# EasyEDA Pro project elisaday-high-color-value-low-cost-reflow-24a201e4.epro, board 控制板-无0402
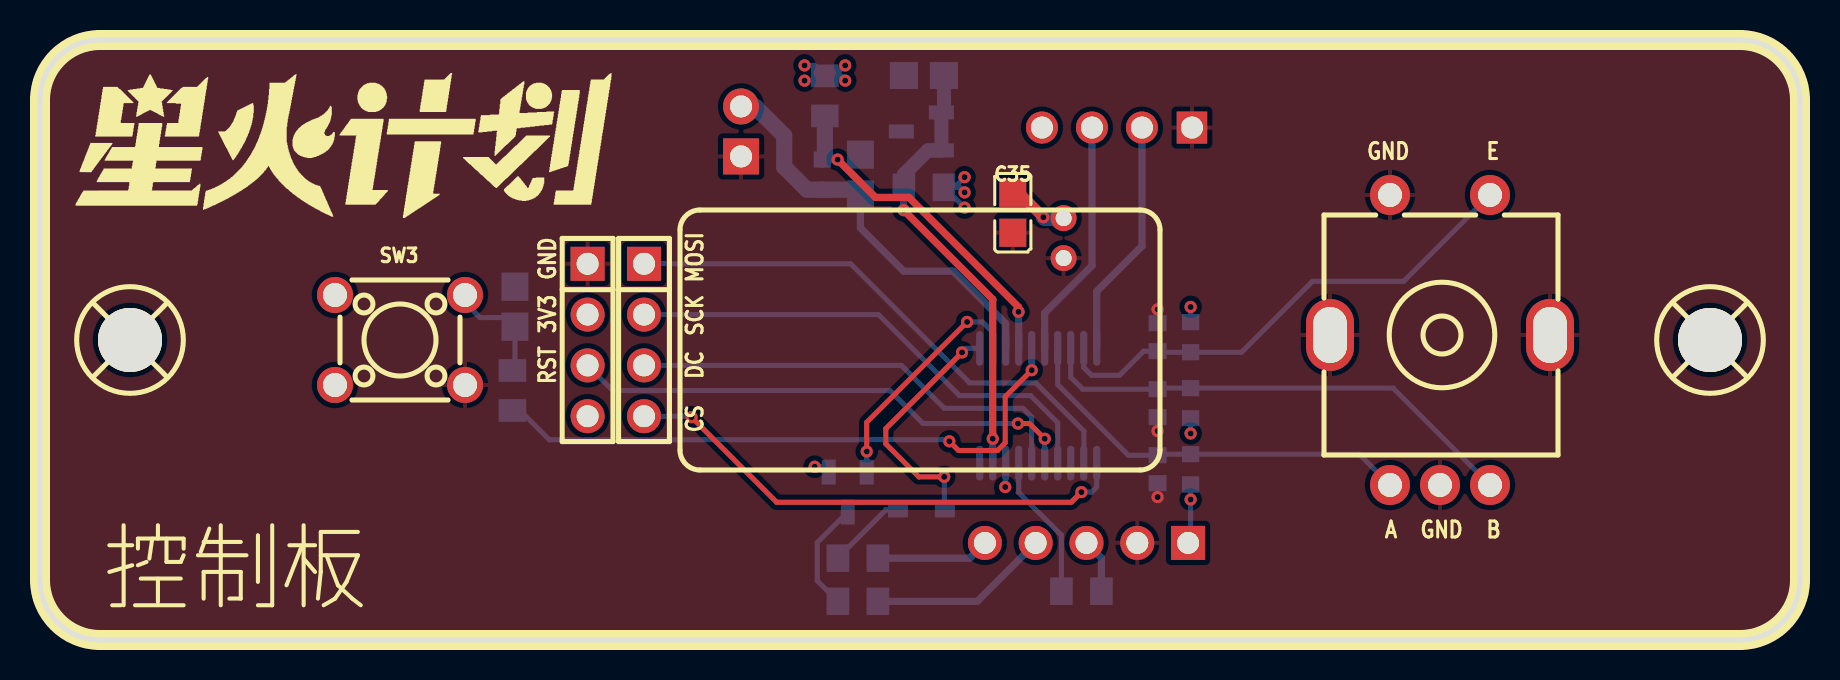
[diagram p3: board, top side]
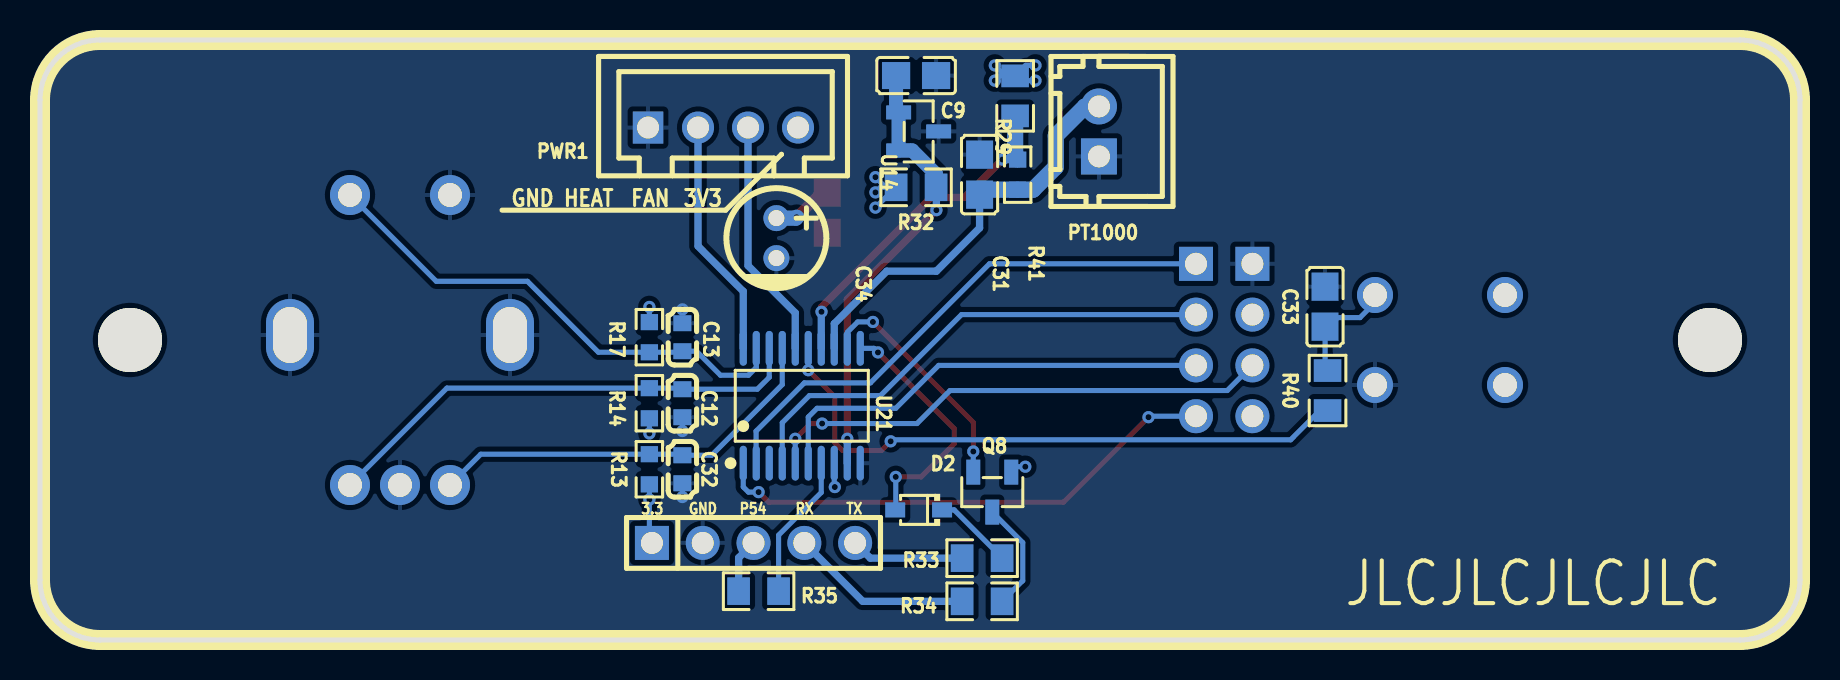
[diagram p4: board, bottom side, seen from below]

Outline 88 x 30 mm; copper layers: Top Layer, Inner1, Inner2, Bottom Layer. Coordinates in mm from the lower left corner of the outline.
Outline path: 0,27 0,3 arc(0.88,0.88) 3,0 85,0 arc(87.12,0.88) 88,3 88,27 arc(87.12,29.12) 85,30 3,30 arc(0.88,29.12) 0,27
Stack: Top Layer 0.035mm 外层铜厚1oz / Dielectric1 0.2104mm 7628 RC49% 8.6mil / Inner1 0.0152mm 内层铜厚 / Dielectric2 1.065mm 1.1mm H/HOZ Copper / Inner2 0.0152mm 内层铜厚 / Dielectric3 0.2104mm 7628 RC49% 8.6mil / Bottom Layer 0.035mm 外层铜厚1oz

## Design rules (mm)
spacing copperThickness1oz (default): track to track 0.102, other pairs 0.152 to 0.3
spacing copperThickness2oz: track to track 0.203, other pairs 0.152 to 0.3
spacing Plane_innerPlane: track to track 0.102, other pairs 0.152 to 0.3
spacing Copper_copperRegion: track to track 0.102, other pairs 0.152 to 0.3
track width copperThickness1oz (default): min 0.127, default 0.254, max 2.54
track width copperThickness2oz: min 0.203, default 0.254, max 2.54
differential pair differentialPair (default): width min 0.127, default 0.254, max 2.54; gap min 0.152, default 0.152
pour e203 uses Copper_copperRegion
pour e241 uses Copper_copperRegion
pour e258 uses Copper_copperRegion
pour e299 uses Copper_copperRegion

## Placement (name value [footprint] x y rotation side)
C9  10uF  [C0805]  44.2 28.22 0 bottom
C12  33nF  [C0603]  55.88 11.84 90 bottom
C13  33nF  [C0603]  55.88 15.14 90 bottom
C31  100nF  [C0805]  41.02 23.27 270 bottom
C32  33nF  [C0603]  55.88 8.54 270 bottom
C33  100nF  [C0805]  23.75 16.67 270 bottom
C34  10uF  [CAP-TH_BD5.0-P2.00-D0.8-FD]  51.18 20.09 270 bottom
C35  100nF  [C0805]  48.64 21.36 90 top
D2  B5819WS  [SOD-323_L1.8-W1.3-LS2.5-RD]  44.07 6.5 0 bottom
H4  PZ254V-11-05P  [HDR-TH_5P-P2.54-V-M]  52.32 4.85 180 bottom
LCD1  PZ254V-11-04P  [HDR-TH_4P-P2.54-V-M]  27.38 15 270 top
LCD3  PZ254V-11-04P  [HDR-TH_4P-P2.54-V-M]  30.2 15 270 top
PT1000  ZX-XH2.54-2PZZ  [CONN-TH_2P-P2.50_HX25003-2A]  35.05 25.43 90 bottom
PWR1  ZX-XH2.54-4PZZ  [CONN-TH_4P-P2.50_4PIN]  53.85 25.62 180 bottom
Q8  SI2302A  [SOT-23-3_L2.9-W1.3-P1.90-LS2.4-BR]  40.39 7.39 90 bottom
R13  3.3kΩ  [R0603]  57.53 8.54 270 bottom
R14  3.3kΩ  [R0603]  57.53 11.84 90 bottom
R17  3.3kΩ  [R0603]  57.53 15.14 270 bottom
R29  1.2kΩ  [R0805]  39.24 27.21 90 bottom
R32  33Ω  [R0805]  44.2 22.63 0 bottom
R33  33Ω  [R0805]  40.89 4.09 0 bottom
R34  33Ω  [R0805]  40.89 1.93 0 bottom
R35  300Ω  [R0805]  52.07 2.44 0 bottom
R40  300Ω  [R0805]  23.62 12.47 270 bottom
R41  1kΩ  [R0603]  39.12 23.27 90 bottom
SCREW1  -  [M3螺丝]  4.5 15 0 top
SCREW2  -  [M3螺丝]  83.5 15 0 top
SW2  EC11N1525404  [SW-TH_EC11NXXXX]  70 15 0 top
SW3  TS665CJ  [SW-TH_4P-L6.0-W6.0-P4.50-LS6.5]  18 15 0 top
U14  TL431BIDBZR  [SOT-23-3_L2.9-W1.3-P1.90-LS2.4-BR]  44.07 25.43 0 bottom
U21  STC8H1K08-36I-TSSOP20  [TSSOP-20_L6.5-W4.4-P0.65-LS6.4-BL]  49.91 11.71 180 bottom

## Footprints (pads in the part's own frame, mm; a bottom-side part is the same pattern mirrored in y, then rotated)
C0603
  rect 0.8x0.9 smd: 1(-0.7,0) 2(0.7,0)
C0805
  rect 1.41x1.35 smd: 1(-1,0) 2(1,0)
CAP-TH_BD5.0-P2.00-D0.8-FD
  round 1.3 hole 0.8: 1(-1,0) 2(1,0)
CONN-TH_2P-P2.50_HX25003-2A
  rect 1.8x1.8 hole 1.1: 1(-1.25,0)
  round 1.8 hole 1.1: 2(1.25,0)
CONN-TH_4P-P2.50_4PIN
  rect 1.524x1.6 hole 1.1: 1(-3.75,0)
  round 1.6 hole 1.1: 2(-1.25,0) 3(1.25,0) 4(3.75,0)
HDR-TH_4P-P2.54-V-M
  rect 1.7x1.7 hole 1.1: 1(-3.81,0)
  round 1.7 hole 1.1: 2(-1.27,0) 3(1.27,0) 4(3.81,0)
HDR-TH_5P-P2.54-V-M
  rect 1.7x1.7 hole 1.1: 1(-5.08,0)
  round 1.7 hole 1.1: 2(-2.54,0) 3(0,0) 4(2.54,0) 5(5.08,0)
M3螺丝
  round 3.2 hole 3.2: 1(0,0)
R0603
  rect 0.806x0.864 smd: 1(-0.753,0) 2(0.753,0)
R0805
  rect 1.133x1.377 smd: 1(-1,0) 2(1,0)
SOD-323_L1.8-W1.3-LS2.5-RD
  rect 1x0.75 smd: 1(-1.173,0) 2(1.173,0)
SOT-23-3_L2.9-W1.3-P1.90-LS2.4-BR
  rect 1.25x0.7 smd: 1(1,-0.95) 2(1,0.95) 3(-1,0)
SW-TH_4P-L6.0-W6.0-P4.50-LS6.5
  round 1.8 hole 1.2: 1(-3.25,2.25) 2(3.25,2.25) 3(-3.25,-2.25) 4(3.25,-2.25)
SW-TH_EC11NXXXX
  round 2 hole 1.2: A(-2.5,-7.25) B(2.5,-7.25) C(0,-7.25) D(-2.5,7.25) E(2.5,7.25)
  oval 2.4x3.6 hole 1.7x2.8: EH(-5.5,0.25) EH(5.5,0.25)
TSSOP-20_L6.5-W4.4-P0.65-LS6.4-BL
  oval 0.364x1.742 smd: 1(-2.925,-2.871) 2(-2.275,-2.871) 3(-1.625,-2.871) 4(-0.975,-2.871) 5(-0.325,-2.871) 6(0.325,-2.871) 7(0.975,-2.871) 8(1.625,-2.871) 9(2.275,-2.871) 10(2.925,-2.871) 11(2.925,2.871) 12(2.275,2.871) 13(1.625,2.871) 14(0.975,2.871) 15(0.325,2.871) 16(-0.325,2.871) 17(-0.975,2.871) 18(-1.625,2.871) 19(-2.275,2.871) 20(-2.925,2.871)

## Nets
As in the schematic.

Pads without a net: LCD1 4; SCREW1 1; SCREW2 1; SW3 1 3; U21 3

## Via types
v1: diameter 0.61, hole 0.305, Top Layer to Bottom Layer, 30 vias

## Routing (per net, layer and track width the routed paths; a pad name or vN(x,y) marks a point on that pad's centre or on a via; arc(x,y) is an arc through that point)
+3.3V: length 16.1
  Top Layer w0.541: v1(50.17,21.14) 48.94,22.36 C35.2
  Bottom Layer w0.254: Q8.1 39.17,8.66 v1(38.74,8.66) ; v1(38.23,28.73) 38.72,28.73 R29.2 39,27.97 v1(38.23,27.97) ; H4.1 57.53,4.98 v1(57.53,7.03) R13.2 ; R17.1 v1(57.53,16.65) ; v1(46.23,22.38) 45.97,22.63 45.72,22.63 v1(46.23,23.14) ; 48.29,8.84 48.29,7.67 v1(48.26,7.65) ; R32.2 45.21,22.63 v1(46.23,21.62) ; v1(40.26,28.73) 39.74,28.21 40.02,28.21 v1(40.26,27.97) ; R14.1 v1(57.53,10.33)
  Bottom Layer w0.762: C34.1 50.21,21.09 v1(50.17,21.14)
GND: length 1.4
  Bottom Layer w0.254: C32.2 v1(55.88,7.15) ; 55.88,11.14 v1(55.88,10.45)
  vias: v1(55.88,16.53)
BTN_RET: length 30.9
  Top Layer w0.254: v1(49.59,13.49) 48.26,12.16 48.26,9.86 47.88,9.48 45.92,9.48 v1(45.47,9.93)
  Bottom Layer w0.254: R40.2 24,11.47 25.47,10.01 45.39,10.01 v1(45.47,9.93) ; U21.15 v1(49.59,13.49)
ENC_A: length 20.6
  Bottom Layer w0.254: U21.17 50.89,12.77 54.42,9.24 55.88,9.24 55.93,9.29 R13.1 65.96,9.29 SW2.A
ENC_B: length 24.7
  Bottom Layer w0.254: U21.18 51.54,13.14 52.13,12.54 C12.2 55.93,12.59 R14.2 67.66,12.59 SW2.B
ENC_K: length 25.2
  Bottom Layer w0.254: SW2.E 68.19,17.94 63.63,17.94 60.08,14.39 R17.2 55.93,14.39 C13.1 55.18,14.44 53.97,13.24 52.58,13.24 52.19,13.63 U21.19
FAN: length 12
  Bottom Layer w0.364: PWR1.3 52.6,18.72 50.24,16.36 U21.16
HEAT_PWM: length 12
  Bottom Layer w0.363: U21.20 52.84,17.43 55.1,19.69 PWR1.2
LCD_CS: length 25.9
  Top Layer w0.254: v1(52.07,7.39) 51.56,6.89 36.83,6.89 v1(32.58,11.14)
  Bottom Layer w0.254: 52.84,8.84 52.84,7.65 52.58,7.39 v1(52.07,7.39) ; v1(32.58,11.14) 32.53,11.19 LCD3.4
LCD_DC: length 22.8
  Bottom Layer w0.254: 49.59,8.84 49.59,11.15 49.15,11.58 45.21,11.58 43.07,13.73 LCD3.3
LCD_MOSI: length 27.1
  Bottom Layer w0.254: 52.19,8.84 52.2,8.85 52.2,10.44 49.78,12.86 46.48,12.86 40.53,18.81 LCD3.1
LCD_RST: length 25.6
  Top Layer w0.254: v1(48.9,10.82) 49.47,10.82 v1(50.24,10.06)
  Bottom Layer w0.254: LCD1.3 28.64,12.47 42.5,12.47 44.15,10.82 v1(48.9,10.82) ; 50.24,8.84 v1(50.24,10.06)
LCD_SCLK: length 24.9
  Bottom Layer w0.254: LCD3.2 41.92,16.27 45.97,12.22 49.53,12.22 50.89,10.86 50.89,8.84
P54_RST: length 7.3
  Bottom Layer w0.254: 48.94,8.84 48.94,7.38 51.07,5.24 51.07,2.57 51.2,2.44
RX_PIN: length 9.1
  Bottom Layer w0.363: H4.4 46.86,1.93 R34.2
RXD: length 12.4
  Top Layer w0.254: v1(45.21,8.16) 43.94,8.16 42.29,9.81 42.29,10.57 v1(46.1,14.38)
  Bottom Layer w0.254: U21.11 46.31,14.58 v1(46.1,14.38) ; v1(45.21,8.16) 45.21,6.53 D2.2
TEMP: length 20.9
  Bottom Layer w0.363: C31.2 41.02,20.6 43.18,18.44 45.66,18.44 48.29,15.82 U21.13
  Bottom Layer w0.808: PT1000.2 35.75,26.68 37.21,25.21 37.21,23.65 38.35,22.52 R41.1 40.77,22.52 C31.2
TEMP_REF: length 17.2
  Top Layer w0.363: v1(39.88,24.02) 41.77,22.13 43.44,22.13 48.92,16.65 v1(48.92,16.41)
  Bottom Layer w0.363: R41.2 v1(39.88,24.02) ; v1(48.92,16.41) 48.94,16.4 U21.14
  Bottom Layer w0.807: R41.2 39.24,24.15 R29.1
TX_PIN: length 5.7
  Bottom Layer w0.363: R33.2 46.48,4.09 H4.5
TXD: length 11.9
  Top Layer w0.254: v1(41.34,9.43) 41.34,10.88 v1(46.35,15.9)
  Bottom Layer w0.254: U21.12 47.62,14.59 47.62,15.39 47.12,15.9 v1(46.35,15.9) ; Q8.2 v1(41.34,9.43)
VREF: length 22.4
  Top Layer w0.363: v1(47.64,10.06) 47.64,17.03 v1(43.18,21.49)
  Bottom Layer w0.363: v1(43.18,21.49) 43.18,22.62 ; 47.64,8.84 v1(47.64,10.06)
  Bottom Layer w0.701: R32.1 43.2,23.28 44.39,24.48 U14.2 U14.1 45.2,26.5 C9.2
$1N1367: length 5.5
  Bottom Layer w0.254: Q8.3 38.86,4.87 38.86,2.97 R34.1
$1N1379: length 2.7
  Bottom Layer w0.363: H4.3 53.07,4.11 R35.2
$1N1427: length 5.9
  Bottom Layer w0.254: 24,13.47 23.75,13.73 23.75,16.12 22,16.12 21.25,16.87 SW3.2
$1N12340: length 4
  Bottom Layer w0.254: R33.1 39.89,4.11 42.29,6.5 D2.1

## Copper pours and planes (outline as drawn; the poured copper is in the pictures)
+3.3V on Inner2: -3.3,33.56 95.25,33.56 95.25,-5.69 -3.3,-5.69
GND on Top Layer: -2.16,33.56 91.31,33.56 91.31,-4.42 -2.16,-4.42
GND on Bottom Layer: -1.91,32.79 91.44,32.79 91.44,-3.02 -1.91,-3.02
GND on Inner1: -3.68,34.57 91.82,34.57 91.82,-4.29 -3.68,-4.29

## Text on the board
Bottom Silkscreen Layer: TX | RX | P54 | GND | 3.3 | 3V3 | FAN | HEAT | JLCJLCJLCJLC
Top Silkscreen Layer: GND | A | E | B | 3V3 | RST | MOSI | SCK | DC | CS | 控制板
